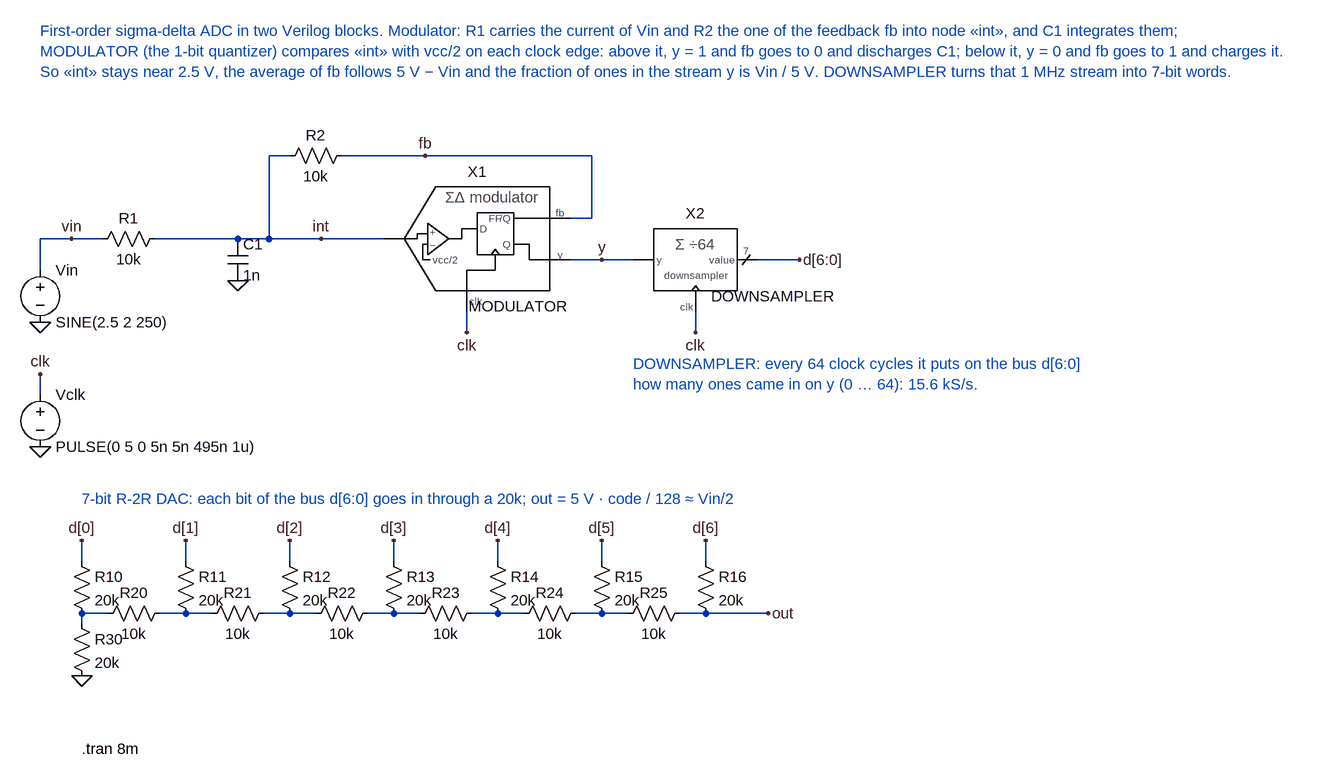
[diagram p0: schematic sigma-delta.asc]
sigma-delta.asc, the LTspice schematic file:
Version 4
SHEET 1 1400 1000
WIRE 96 272 96 224
WIRE 96 224 192 224
WIRE 272 224 624 224
WIRE 912 192 944 192
WIRE 944 192 944 96
WIRE 944 96 560 96
WIRE 480 96 448 96
WIRE 448 96 448 224
WIRE 752 336 752 368
WIRE 912 256 960 256
WIRE 960 256 1008 256
WIRE 1200 256 1264 256
WIRE 1104 336 1104 368
WIRE 96 432 96 464
WIRE 160 688 160 720
WIRE 160 800 200 800
WIRE 280 800 320 800
WIRE 320 688 320 720
WIRE 320 800 360 800
WIRE 440 800 480 800
WIRE 480 688 480 720
WIRE 480 800 520 800
WIRE 600 800 640 800
WIRE 640 688 640 720
WIRE 640 800 680 800
WIRE 760 800 800 800
WIRE 800 688 800 720
WIRE 800 800 840 800
WIRE 920 800 960 800
WIRE 960 688 960 720
WIRE 960 800 1000 800
WIRE 1080 800 1120 800
WIRE 1120 688 1120 720
WIRE 160 800 160 816
WIRE 1120 800 1216 800
FLAG 96 352 0
FLAG 144 224 vin
FLAG 400 288 0
FLAG 528 224 int
FLAG 688 96 fb
FLAG 752 368 clk
FLAG 960 256 y
FLAG 1264 256 d[6:0]
FLAG 1104 368 clk
FLAG 96 432 clk
FLAG 96 544 0
FLAG 160 688 d[0]
FLAG 320 688 d[1]
FLAG 480 688 d[2]
FLAG 640 688 d[3]
FLAG 800 688 d[4]
FLAG 960 688 d[5]
FLAG 1120 688 d[6]
FLAG 160 896 0
FLAG 1216 800 out
SYMBOL voltage 96 256 R0
SYMATTR InstName Vin
SYMATTR Value SINE(2.5 2 250)
SYMBOL res 288 208 R90
WINDOW 0 0 56 VBottom 2
WINDOW 3 32 56 VTop 2
SYMATTR InstName R1
SYMATTR Value 10k
SYMBOL cap 384 224 R0
SYMATTR InstName C1
SYMATTR Value 1n
SYMBOL res 576 80 R90
WINDOW 0 0 56 VBottom 2
WINDOW 3 32 56 VTop 2
SYMATTR InstName R2
SYMATTR Value 10k
SYMBOL MODULATOR 768 224 R0
SYMATTR InstName X1
SYMBOL DOWNSAMPLER 1104 256 R0
SYMATTR InstName X2
SYMBOL voltage 96 448 R0
SYMATTR InstName Vclk
SYMATTR Value PULSE(0 5 0 5n 5n 495n 1u)
SYMBOL res 144 704 R0
SYMATTR InstName R10
SYMATTR Value 20k
SYMBOL res 296 784 R90
WINDOW 0 0 56 VBottom 2
WINDOW 3 32 56 VTop 2
SYMATTR InstName R20
SYMATTR Value 10k
SYMBOL res 304 704 R0
SYMATTR InstName R11
SYMATTR Value 20k
SYMBOL res 456 784 R90
WINDOW 0 0 56 VBottom 2
WINDOW 3 32 56 VTop 2
SYMATTR InstName R21
SYMATTR Value 10k
SYMBOL res 464 704 R0
SYMATTR InstName R12
SYMATTR Value 20k
SYMBOL res 616 784 R90
WINDOW 0 0 56 VBottom 2
WINDOW 3 32 56 VTop 2
SYMATTR InstName R22
SYMATTR Value 10k
SYMBOL res 624 704 R0
SYMATTR InstName R13
SYMATTR Value 20k
SYMBOL res 776 784 R90
WINDOW 0 0 56 VBottom 2
WINDOW 3 32 56 VTop 2
SYMATTR InstName R23
SYMATTR Value 10k
SYMBOL res 784 704 R0
SYMATTR InstName R14
SYMATTR Value 20k
SYMBOL res 936 784 R90
WINDOW 0 0 56 VBottom 2
WINDOW 3 32 56 VTop 2
SYMATTR InstName R24
SYMATTR Value 10k
SYMBOL res 944 704 R0
SYMATTR InstName R15
SYMATTR Value 20k
SYMBOL res 1096 784 R90
WINDOW 0 0 56 VBottom 2
WINDOW 3 32 56 VTop 2
SYMATTR InstName R25
SYMATTR Value 10k
SYMBOL res 1104 704 R0
SYMATTR InstName R16
SYMATTR Value 20k
SYMBOL res 144 800 R0
SYMATTR InstName R30
SYMATTR Value 20k
TEXT 96 -96 Left 2 ;First-order sigma-delta ADC in two Verilog blocks. Modulator: R1 carries the current of Vin and R2 the one of the feedback fb into node «int», and C1 integrates them;\nMODULATOR (the 1-bit quantizer) compares «int» with vcc/2 on each clock edge: above it, y = 1 and fb goes to 0 and discharges C1; below it, y = 0 and fb goes to 1 and charges it.\nSo «int» stays near 2.5 V, the average of fb follows 5 V − Vin and the fraction of ones in the stream y is Vin / 5 V. DOWNSAMPLER turns that 1 MHz stream into 7-bit words.
TEXT 1008 416 Left 2 ;DOWNSAMPLER: every 64 clock cycles it puts on the bus d[6:0]\nhow many ones came in on y (0 … 64): 15.6 kS/s.
TEXT 160 624 Left 2 ;7-bit R-2R DAC: each bit of the bus d[6:0] goes in through a 20k; out = 5 V · code / 128 ≈ Vin/2
TEXT 160 1008 Left 2 !.tran 8m

The netlist it stands for:
* sigma-delta.asc
Vin vin 0 SINE(2.5 2 250)
R1 int vin 10k
C1 int 0 1n
R2 fb int 10k
XX1 clk int y fb MODULATOR  ; pins clk cmp y fb
XX2 clk y d[6] d[5] d[4] d[3] d[2] d[1] d[0] DOWNSAMPLER  ; pins clk y value[6:0]
Vclk clk 0 PULSE(0 5 0 5n 5n 495n 1u)
R10 d[0] N001 20k
R20 N002 N001 10k
R11 d[1] N002 20k
R21 N003 N002 10k
R12 d[2] N003 20k
R22 N004 N003 10k
R13 d[3] N004 20k
R23 N005 N004 10k
R14 d[4] N005 20k
R24 N006 N005 10k
R15 d[5] N006 20k
R25 out N006 10k
R16 d[6] out 20k
R30 N001 0 20k
* First-order sigma-delta ADC in two Verilog blocks. Modulator: R1 carries the current of Vin and R2 the one of the feedback fb into node «int», and C1 integrates them;
* MODULATOR (the 1-bit quantizer) compares «int» with vcc/2 on each clock edge: above it, y = 1 and fb goes to 0 and discharges C1; below it, y = 0 and fb goes to 1 and charges it.
* So «int» stays near 2.5 V, the average of fb follows 5 V − Vin and the fraction of ones in the stream y is Vin / 5 V. DOWNSAMPLER turns that 1 MHz stream into 7-bit words.
* DOWNSAMPLER: every 64 clock cycles it puts on the bus d[6:0]
* how many ones came in on y (0 … 64): 15.6 kS/s.
* 7-bit R-2R DAC: each bit of the bus d[6:0] goes in through a 20k; out = 5 V · code / 128 ≈ Vin/2
.tran 8m
.lib MODULATOR.sub
.lib DOWNSAMPLER.sub
.backanno
.end